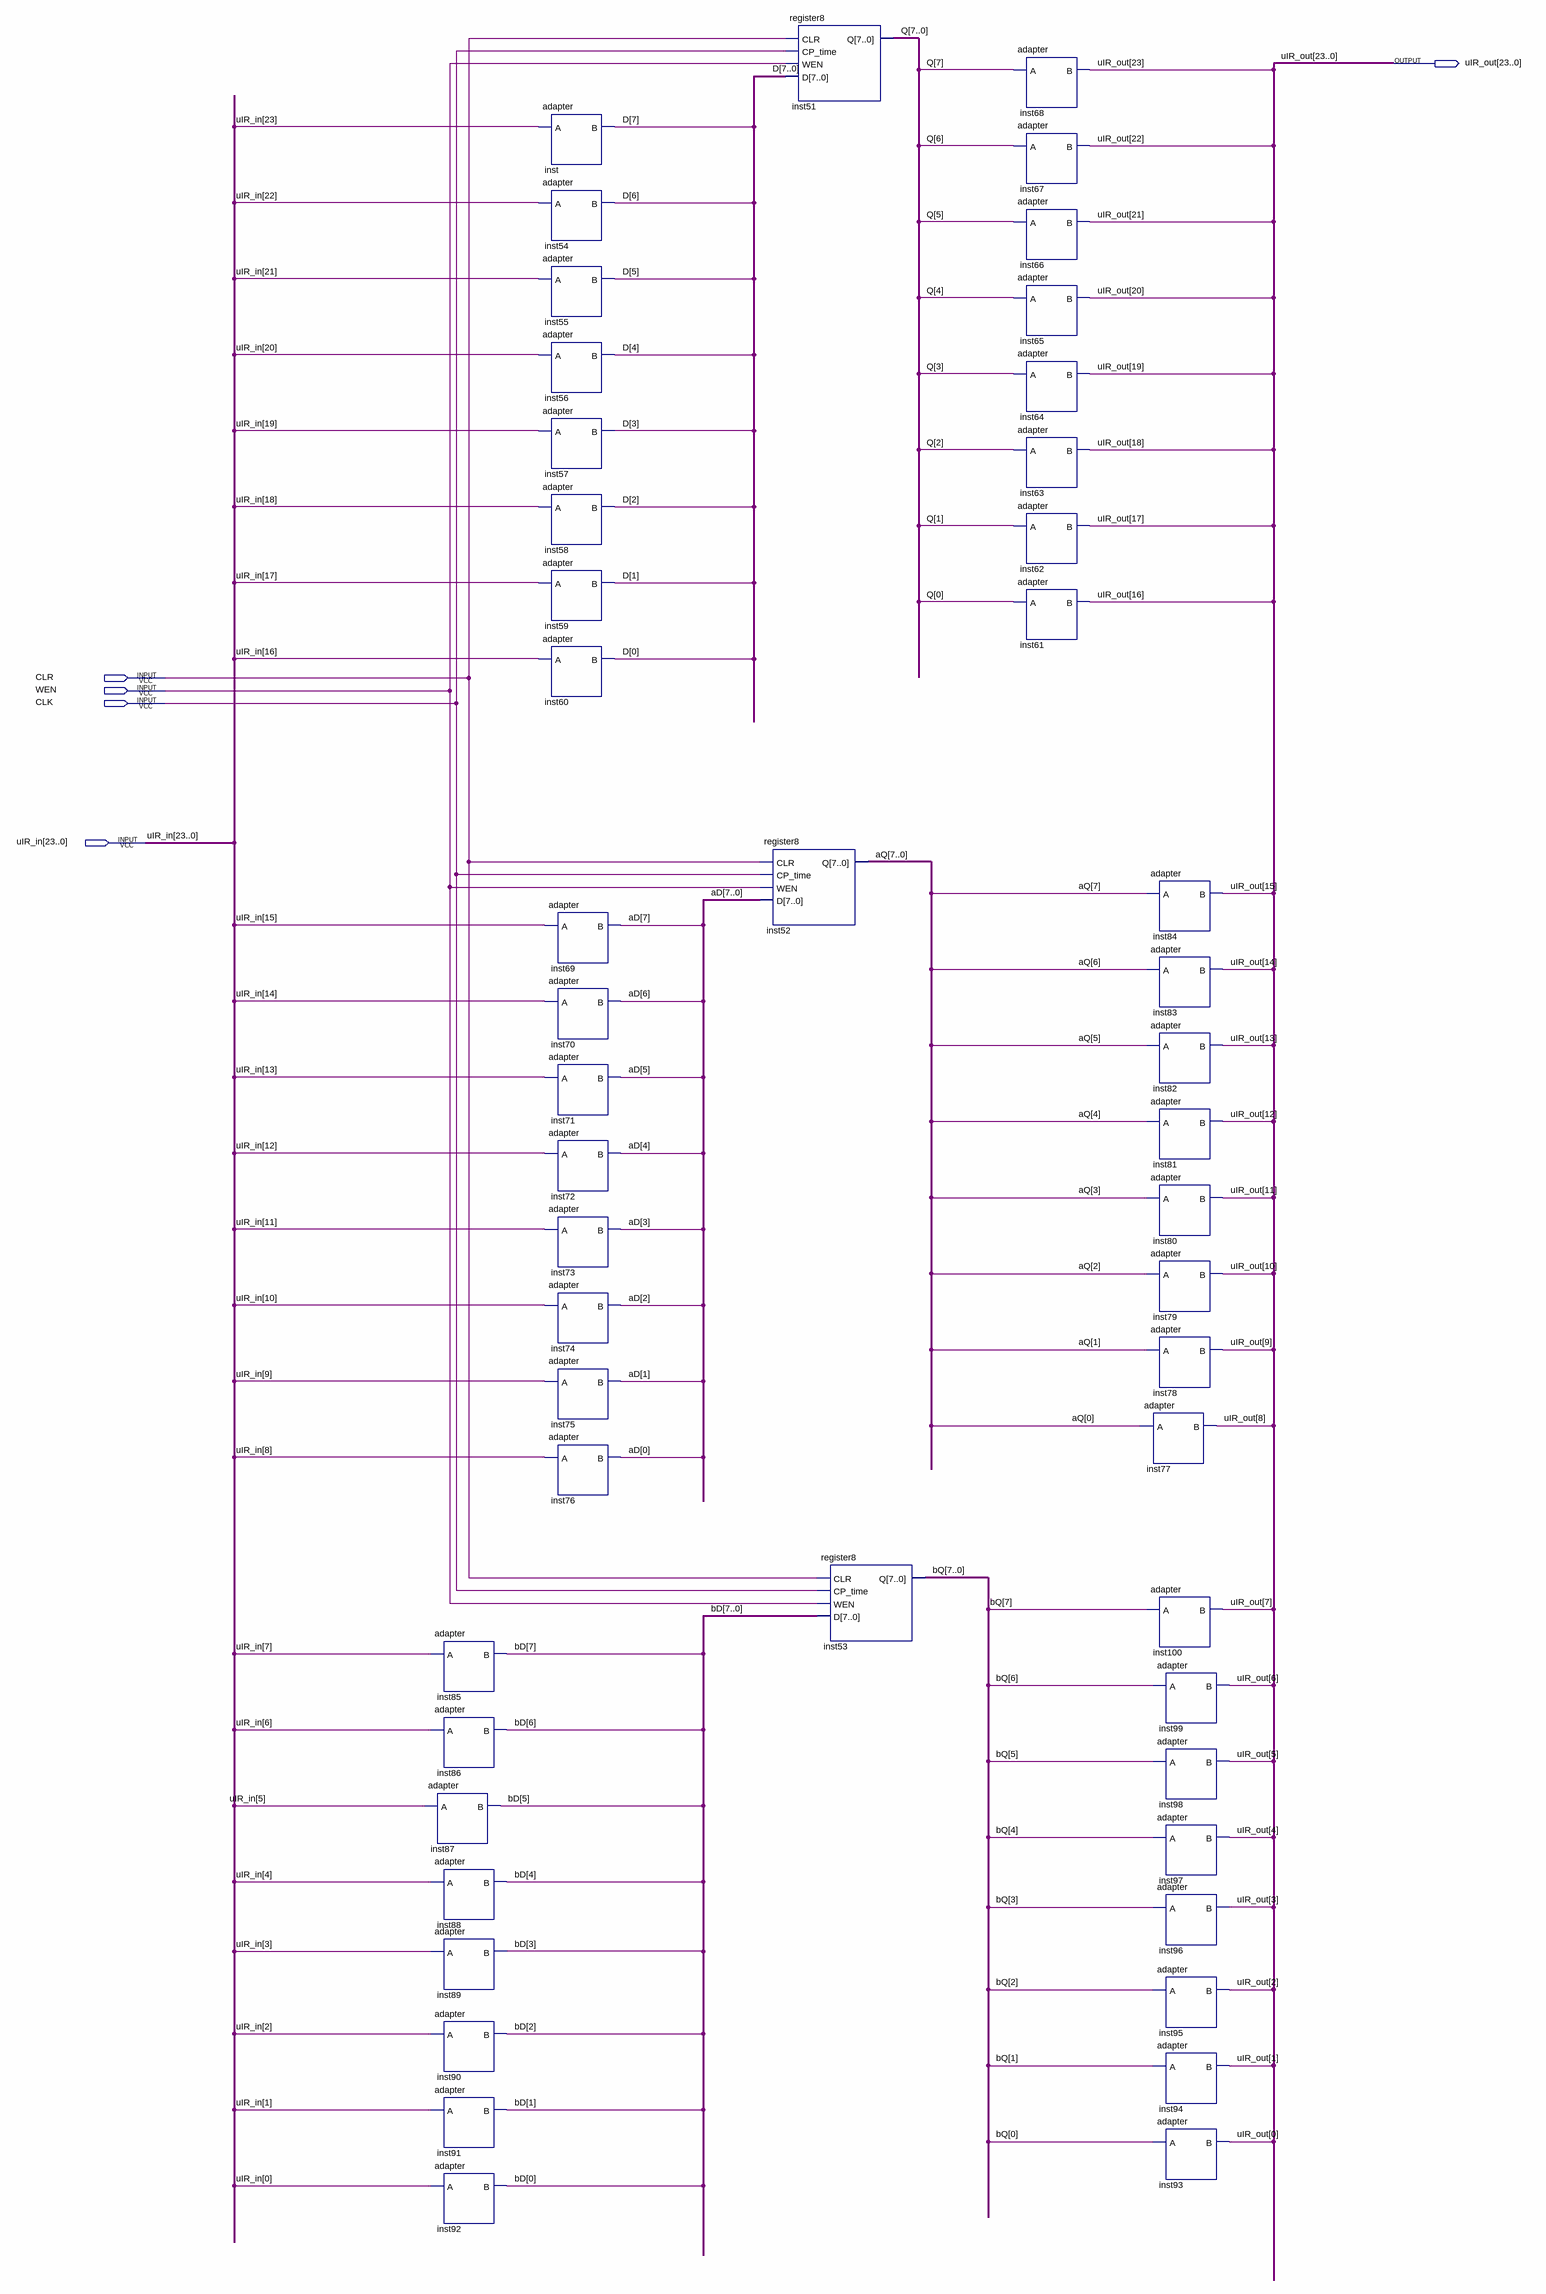
[diagram p0: schematic sheet]
// Quartus schematic uIR_hxgdly.bdf as structural Verilog: 51 symbols, 5 pins
module uIR_hxgdly (
  input  CLR,
  input  WEN,
  input  CLK,
  input  [23:0] uIR_in,
  output [23:0] uIR_out
);

  wire [7:0] aD, aQ, bD, bQ, D, Q;

  adapter inst85 (.A(uIR_in[7]), .B(bD[7]));
  adapter inst86 (.A(uIR_in[6]), .B(bD[6]));
  adapter inst87 (.A(uIR_in[5]), .B(bD[5]));
  adapter inst88 (.A(uIR_in[4]), .B(bD[4]));
  adapter inst89 (.A(uIR_in[3]), .B(bD[3]));
  adapter inst90 (.A(uIR_in[2]), .B(bD[2]));
  adapter inst91 (.A(uIR_in[1]), .B(bD[1]));
  adapter inst92 (.A(uIR_in[0]), .B(bD[0]));
  adapter inst (.A(uIR_in[23]), .B(D[7]));
  adapter inst54 (.A(uIR_in[22]), .B(D[6]));
  adapter inst55 (.A(uIR_in[21]), .B(D[5]));
  adapter inst56 (.A(uIR_in[20]), .B(D[4]));
  adapter inst57 (.A(uIR_in[19]), .B(D[3]));
  adapter inst58 (.A(uIR_in[18]), .B(D[2]));
  adapter inst59 (.A(uIR_in[17]), .B(D[1]));
  adapter inst60 (.A(uIR_in[16]), .B(D[0]));
  adapter inst69 (.A(uIR_in[15]), .B(aD[7]));
  adapter inst70 (.A(uIR_in[14]), .B(aD[6]));
  adapter inst71 (.A(uIR_in[13]), .B(aD[5]));
  adapter inst72 (.A(uIR_in[12]), .B(aD[4]));
  adapter inst73 (.A(uIR_in[11]), .B(aD[3]));
  adapter inst74 (.A(uIR_in[10]), .B(aD[2]));
  adapter inst75 (.A(uIR_in[9]), .B(aD[1]));
  adapter inst76 (.A(uIR_in[8]), .B(aD[0]));
  register8 inst51 (.CLR(CLR), .CP_time(CLK), .WEN(WEN), .D(D), .Q(Q));
  register8 inst52 (.CLR(CLR), .CP_time(CLK), .WEN(WEN), .D(aD), .Q(aQ));
  register8 inst53 (.CLR(CLR), .CP_time(CLK), .WEN(WEN), .D(bD), .Q(bQ));
  adapter inst68 (.A(Q[7]), .B(uIR_out[23]));
  adapter inst67 (.A(Q[6]), .B(uIR_out[22]));
  adapter inst66 (.A(Q[5]), .B(uIR_out[21]));
  adapter inst65 (.A(Q[4]), .B(uIR_out[20]));
  adapter inst64 (.A(Q[3]), .B(uIR_out[19]));
  adapter inst63 (.A(Q[2]), .B(uIR_out[18]));
  adapter inst62 (.A(Q[1]), .B(uIR_out[17]));
  adapter inst61 (.A(Q[0]), .B(uIR_out[16]));
  adapter inst84 (.A(aQ[7]), .B(uIR_out[15]));
  adapter inst83 (.A(aQ[6]), .B(uIR_out[14]));
  adapter inst82 (.A(aQ[5]), .B(uIR_out[13]));
  adapter inst81 (.A(aQ[4]), .B(uIR_out[12]));
  adapter inst80 (.A(aQ[3]), .B(uIR_out[11]));
  adapter inst79 (.A(aQ[2]), .B(uIR_out[10]));
  adapter inst78 (.A(aQ[1]), .B(uIR_out[9]));
  adapter inst77 (.A(aQ[0]), .B(uIR_out[8]));
  adapter inst100 (.A(bQ[7]), .B(uIR_out[7]));
  adapter inst99 (.A(bQ[6]), .B(uIR_out[6]));
  adapter inst98 (.A(bQ[5]), .B(uIR_out[5]));
  adapter inst97 (.A(bQ[4]), .B(uIR_out[4]));
  adapter inst96 (.A(bQ[3]), .B(uIR_out[3]));
  adapter inst95 (.A(bQ[2]), .B(uIR_out[2]));
  adapter inst94 (.A(bQ[1]), .B(uIR_out[1]));
  adapter inst93 (.A(bQ[0]), .B(uIR_out[0]));
endmodule
